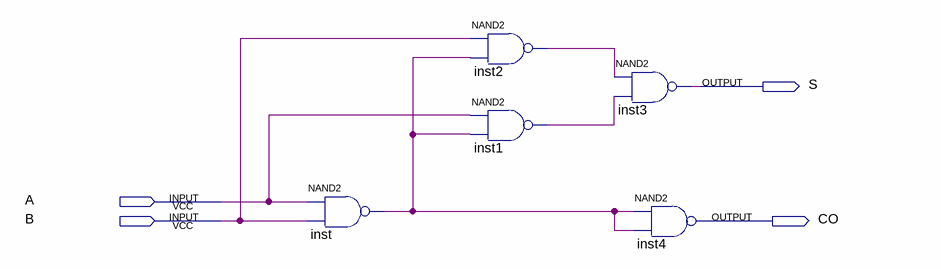
[diagram p0: schematic sheet]
// Quartus schematic H_ADDER.bdf as structural Verilog: 5 symbols, 4 pins
module H_ADDER (
  input  A,
  input  B,
  output S,
  output CO
);

  wire inst1_out, inst2_out, inst_out;

  nand inst (inst_out, A, B);
  nand inst2 (inst2_out, B, inst_out);
  nand inst1 (inst1_out, A, inst_out);
  nand inst3 (S, inst2_out, inst1_out);
  nand inst4 (CO, inst_out, inst_out);
endmodule
